# Altium schematic sheet Charge Managment ICs.SchDoc
size A4; SheetNumber: 2; SheetTotal: 3; SPICEModelCacheYUDMBZLM: <root> / <DocumentId>YUDMBZLM</DocumentId> / </root>
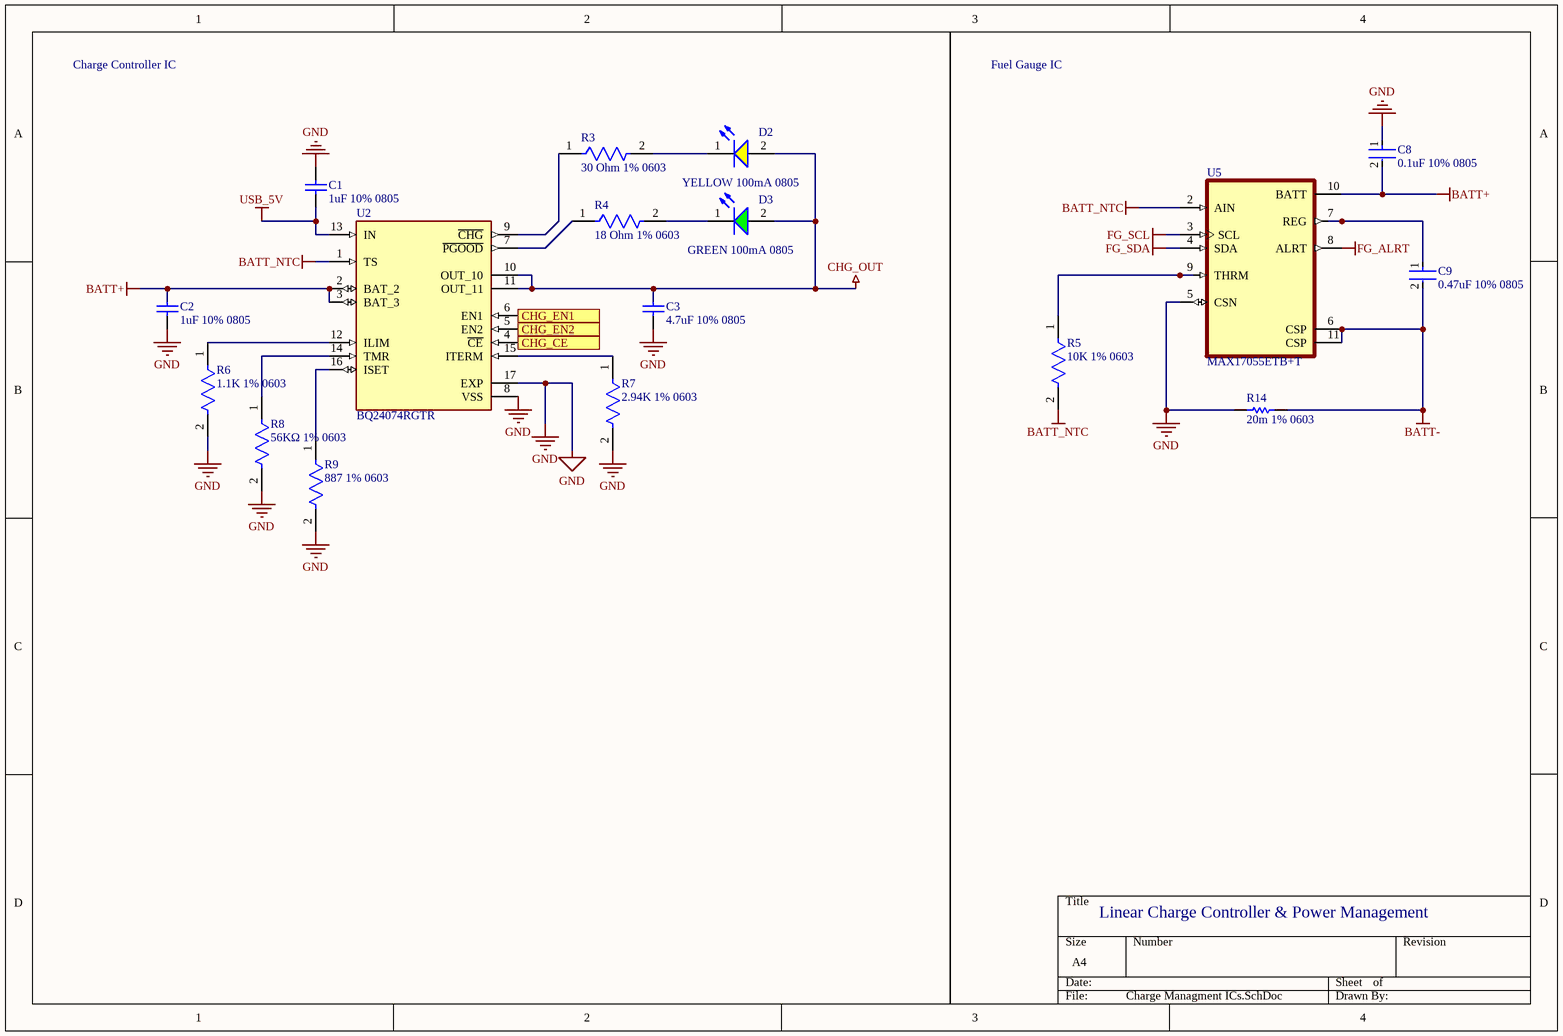
[diagram p0: Charge Managment ICs.SchDoc]

## Parts
C1  1uF 10% 0805  [CAPC2013X100X50LL20T25]
C2  1uF 10% 0805  [CAPC2013X100X50LL20T25]
C3  4.7uF 10% 0805  [CAPC2013X145X50ML20T25]
C8  0.1uF 10% 0805  [FP-AC0805-0_85-MFG]
C9  0.47uF 10% 0805  [FP-C0805C-DN-MFG]
D2  YELLOW 100mA 0805  [WL-SMCW_0805_150080xx75000]
D3  GREEN 100mA 0805  [WL-SMCW_0805_150080xx75000]
R3  30 Ohm 1% 0603  [FP-AC0603-IPC_B]
R4  18 Ohm 1% 0603  [FP-AC0603-MFG]
R5  10K 1% 0603  [FP-AC0603-MFG]
R6  1.1K 1% 0603  [FP-AC0603-IPC_B]
R7  2.94K 1% 0603  [FP-AC0603-IPC_A]
R8  56KΩ 1% 0603  [FP-AC0603-MFG]
R9  887 1% 0603  [FP-RMCF0603-IPC_A]
R14  20m 1% 0603  [RESC1508X46X38ML25T25]
U2  BQ24074RGTR  [QFN50P300X300X100-17N]
U5  MAX17055ETB+T  [SON40P200X250X80-11N]

## Ports
CHG_CE (in), CHG_EN1 (in), CHG_EN2 (in)

## Nets
BATT+: C2.2 C8.2 U2.2(BAT_2) U2.3(BAT_3) U5.10(BATT)
BATT-: C9.2 R14.2 U5.6(CSP) U5.11(CSP)
BATT_NTC: R5.2 U2.1(TS) U5.2(AIN)
CHG_OUT: C3.2 D2.2(A) D3.2(A) U2.10(OUT_10) U2.11(OUT_11)
FG_ALRT: U5.8(ALRT)
FG_SCL: U5.3(SCL)
FG_SDA: U5.4(SDA)
GND: C1.2 C2.1 C3.1 C8.1 R6.2 R7.2 R8.2 R9.2 R14.1 U2.8(VSS) U2.17(EXP) U5.5(CSN)
USB_5V: C1.1 U2.13(IN)
CHG_CE: U2.4(~{CE}) ; port CHG_CE
CHG_EN1: U2.6(EN1) ; port CHG_EN1
CHG_EN2: U2.5(EN2) ; port CHG_EN2
NetC9_1: C9.1 U5.7(REG)
NetD2_1: D2.1(K) R3.2
NetD3_1: D3.1(K) R4.2
NetR3_1: R3.1 U2.9(~{CHG})
NetR4_1: R4.1 U2.7(~{PGOOD})
NetR5_1: R5.1 U5.9(THRM)
NetR6_1: R6.1 U2.12(ILIM)
NetR7_1: R7.1 U2.15(ITERM)
NetR8_1: R8.1 U2.14(TMR)
NetR9_1: R9.1 U2.16(ISET)

## Notes on the sheet
- Charge Controller IC
- Fuel Gauge IC
- Linear Charge Controller & Power Management

## Library data of the parts
C1 C2 = CMP-1036-04732-2: Manufacturer: Kemet; Part Number: C0805C105K9RACTU
C3 = CMP-2007-01048-1: Part Number: C0805C475K4RACTU; Manufacturer: Kemet
C8 = CMP-03422-000831-1: AC0805 100 nF X7R 10.00% 50 V; Manufacturer: Yageo; Manufacturer Part Number: AC0805KKX7R9BB104; Value: 100 nF; Voltage Rating: 50 V; Tolerance: 0.1; Automotive Grade: Grade 1; Material: Ceramic; Temperature Coefficient: 15%; Octopart: https://octopart.com/ac0805kkx7r9bb104-yageo-90326560; Temperature Range High: +125°C; Footprint Url: http://www.yageo.com/exep/pages/download/literatures/UPY-C_GEN_24.pdf; ComponentLink2Description: Datasheet; Temperature: -55°C to +125°C; Temperature Range Low: -55°C; ComponentLink2URL: http://www.yageo.com/documents/recent/UPY-AC_NP0X7R_16V-to-630V_12.pdf; Height: 0.95mm; RoHS: TRUE; Device Class L1: Passive Components; Capacitance: 100 nF; Lead Free: Yes; Package: AC0805-0.85; Device Class L2: Capacitors; Automotive: Yes; Category: Cap; Temperature Characteristic: X7R; Ipc Land Pattern Name: CAPC200125X85; Device Class L3: Ceramic Capacitors
C9 = CMP-1036-04645-2: CAP CER 0.47UF 25V X7R 0805; Manufacturer: KEMET; Manufacturer Part Number: C0805C474K3RACTU; Material: Ceramic; Value: 0.47 μF; Tolerance: 0.1; Temperature Coefficient: 30ppm/°C; Lead Free: Yes; Device Class L1: Passive Components; ComponentLink2Description: Datasheet; Category: Cap; Temperature: -55°C to +125°C; RoHS: TRUE; Capacitance: 0.47 μF; Automotive: No; Height: 0.88mm; Digikey Description: CAP CER 0.47UF 25V X7R 0805; Device Class L3: Ceramic Capacitors; Package: C0805C-DN; Voltage Rating: 25 V; Octopart: https://octopart.com/c0805c474k3ractu-kemet-90785; Temperature Characteristic: X7R; Temperature Range Low: -55°C; Temperature Range High: +125°C; Device Class L2: Capacitors; Ipc Land Pattern Name: CAPC200125X78; ComponentLink2URL: https://content.kemet.com/datasheets/KEM_C1003_C0G_SMD.pdf
D2 = CMP-1426-00012-4: 2 V Yellow LED 2012 (0805) SMD, Wurth Elektronik WL-SMCW 150080YS75000; Manufacturer Package Identifier: 0805 (2012 metric); Manufacturer Lifecycle Status: ACTIVE; Luminous Intensity: 120mcd; Dominant Wavelength: 590nm; Forward Voltage: 2V; Lens Style: Clear, Rectangular; Reverse Voltage: 5V; YEOL: 1 = Estimated lifetime > 10 years; Viewing Angle: 140°; Power Dissipation: 72mW; Peak Wavelength: 595nm; Max Junction Temperature (Tj): 95°C; Test Current: 20mA; Lifecycle Status: Production; Case Code (Imperial): 0805; Height: 700µm; Min Operating Temperature: -40°C; Case Code (Metric): 2012; RoHS: Compliant; Max Reverse Voltage (DC): 5V; Width: 1.25mm; Case/Package: 0805; Mount: Surface Mount; REACH SVHC: Unknown; Color: Yellow; Packaging: Tape and Reel; Max Operating Temperature: 85°C; Forward Current: 100mA; Length: 2mm; Wavelength: 590nm
D3 = CMP-1426-00007-4: WURTH ELEKTRONIK - 150080GS75000 - LED, Green, SMD, 0805, 30 mA, 3.2 V, 520 nm; Manufacturer Lifecycle Status: ACTIVE; Manufacturer Package Identifier: 0805 (2012 metric); Test Current: 20mA; Wavelength: 525nm; Max Junction Temperature (Tj): 95°C; Luminous Intensity: 450mcd; Reverse Voltage: 5V; Viewing Angle: 140°; Peak Wavelength: 515nm; Lens Style: Clear, Rectangular; Power Dissipation: 105mW; YEOL: 1 = Estimated lifetime > 10 years; Forward Voltage: 3.2V; Mount: Surface Mount; REACH SVHC: Unknown; Height: 700µm; Case Code (Metric): 2012; Case Code (Imperial): 0805; Forward Current: 100mA; Dominant Wavelength: 525nm; RoHS: Compliant; Color: Green; Case/Package: 0805; Length: 2mm; Packaging: Tape and Reel; Max Reverse Voltage (DC): 5V; Min Operating Temperature: -40°C; Max Operating Temperature: 85°C; Width: 1.25mm; Lifecycle Status: Production
R3 = CMP-03412-028950-2: RES 30Ω 1.00% 0.1W 0603; Max Power Dissipation: 100mW; Temperature Coefficient: 100ppm/°C; Resistance: 30R; Features: Moisture Resistant; Packaging: Tape and Reel; Number of Terminations: 2; Tolerance: 1%; Case/Package: 0603; Length: 0.063inch; Resistor Type: Thick Film; Series: AC; RoHS Compliant: Yes; Height: 0.022inch; Width: 0.031inch; Max Operating Temperature: 155°C; Min Operating Temperature: -55°C
R4 = CMP-03412-005942-2: RES 18Ω 1.00% 0.1W 0603; Resistance: 18R; Max Power Dissipation: 100mW; Temperature Coefficient: 100ppm/°C; Height: 0.022inch; Max Operating Temperature: 155°C; Number of Terminations: 2; Length: 0.063inch; Tolerance: 1%; Depth: 0.8mm; Width: 0.031inch; Packaging: Tape and Reel; Min Operating Temperature: -55°C; Series: AC; Resistor Type: Thick Film; Case/Package: 0603; Features: Moisture Resistant; RoHS Compliant: Yes; Military Standard: Not
R5 = CMP-03412-038110-1: RES 10.5KΩ 1.00% 0.1W 0603; RoHS Compliant: Yes
R6 = CMP-03412-029129-2: RES 1.1KΩ 1.00% 0.1W 0603; Max Power Dissipation: 100mW; Resistance: 1.1kR; Voltage Rating: 50V; Temperature Coefficient: 100ppm/°C; Width: 0.8mm; Number of Terminations: 2; Case Code (Imperial): 0603; Max Operating Temperature: 155°C; Power Rating: 100mW; Min Operating Temperature: -55°C; RoHS Compliant: Yes; Series: AC; Length: 0.063inch; Termination: SMD/SMT; Packaging: Tape and Reel; Case/Package: 0603; Features: Moisture Resistant; Height: 0.022inch; Case Code (Metric): 1608; Resistor Type: Thick Film; Tolerance: 1%
R7 = CMP-03412-000673-2: RES 2.94KΩ 1.00% 0.1W 0603; Resistance: 2.94kR; Power Rating: 100mW; Voltage Rating: 50V; Temperature Coefficient: 100ppm/°C; Weight: 7.1E-05oz; Length: 0.063inch; RoHS Compliant: Yes; Features: Moisture Resistant; Max Operating Temperature: 155°C; Series: AC; Case Code (Imperial): 0603; Tolerance: 1%; Width: 0.8mm; Case Code (Metric): 1608; Max Power Dissipation: 100mW; Number of Terminations: 2; Termination: SMD/SMT; Resistor Type: Thick Film; Min Operating Temperature: -55°C; Height: 0.022inch; Packaging: Tape and Reel; Case/Package: 0603
R8 = CMP-03412-027575-2: RES 56KΩ 1.00% 0.1W 0603; RoHS Compliant: Yes
R9 = CMP-26527-006687-1: 887kΩ ±1% 0.1W 0603 Thick Film Chip Resistor AEC-Q200 compliant; Temperature Coefficient: 100ppm/°C; Resistance: 887kR; Mount: Surface Mount; RoHS Compliant: Yes; Tolerance: 1%; Packaging: Tape and Reel; Max Operating Temperature: 155°C; Min Operating Temperature: -55°C; Resistor Type: Thick Film; Case/Package: 0603; Radiation Hardening: No; Contact Plating: Tin
R14 = CMP-2000-03802-1: Manufacturer: Vishay Dale; Part Number: WSL0603R0200FEA
U2 = BQ24074RGTR: Standalone 1-cell 1.5-A linear battery charger, Power Path, 4.2-V VBAT, 10.5-V OVP and 4.4-V VOUT; MF: Texas Instruments; SnapEDA_Link: https://www.snapeda.com/parts/BQ24074RGTR/Texas+Instruments/view-part/?ref=snap; Package: VQFN-16 Texas Instruments; Value: *; MP: BQ24074RGTR; Check_prices: https://www.snapeda.com/parts/BQ24074RGTR/Texas+Instruments/view-part/?ref=eda
U5 = MAX17055ETB+T: Battery Battery Monitor IC Multi-Chemistry 10-TDFN (2.5x2); MF: Maxim Integrated Products; Check_prices: https://www.snapeda.com/parts/MAX17055ETB+T/Maxim+Integrated/view-part/?ref=eda; Package: None; MP: MAX17055ETB+T; Value: *; Availability: In Stock; Purchase-URL: https://pricing.snapeda.com/search/part/MAX17055ETB+T/?ref=eda; SnapEDA_Link: https://www.snapeda.com/parts/MAX17055ETB+T/Maxim+Integrated/view-part/?ref=snap; Price: None